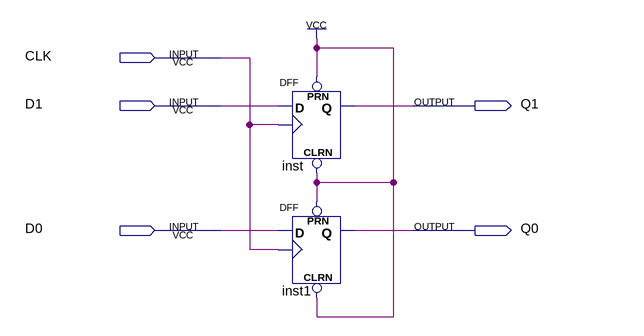
[diagram p0: schematic sheet]
// Quartus schematic current.bdf as structural Verilog: 2 symbols, 5 pins
module current (
  input  CLK,
  input  D1,
  input  D0,
  output Q1,
  output Q0
);

  DFF inst (.CLRN(1'b1), .CLK(CLK), .D(D1), .PRN(1'b1), .Q(Q1));
  DFF inst1 (.CLRN(1'b1), .CLK(CLK), .D(D0), .PRN(1'b1), .Q(Q0));
endmodule
